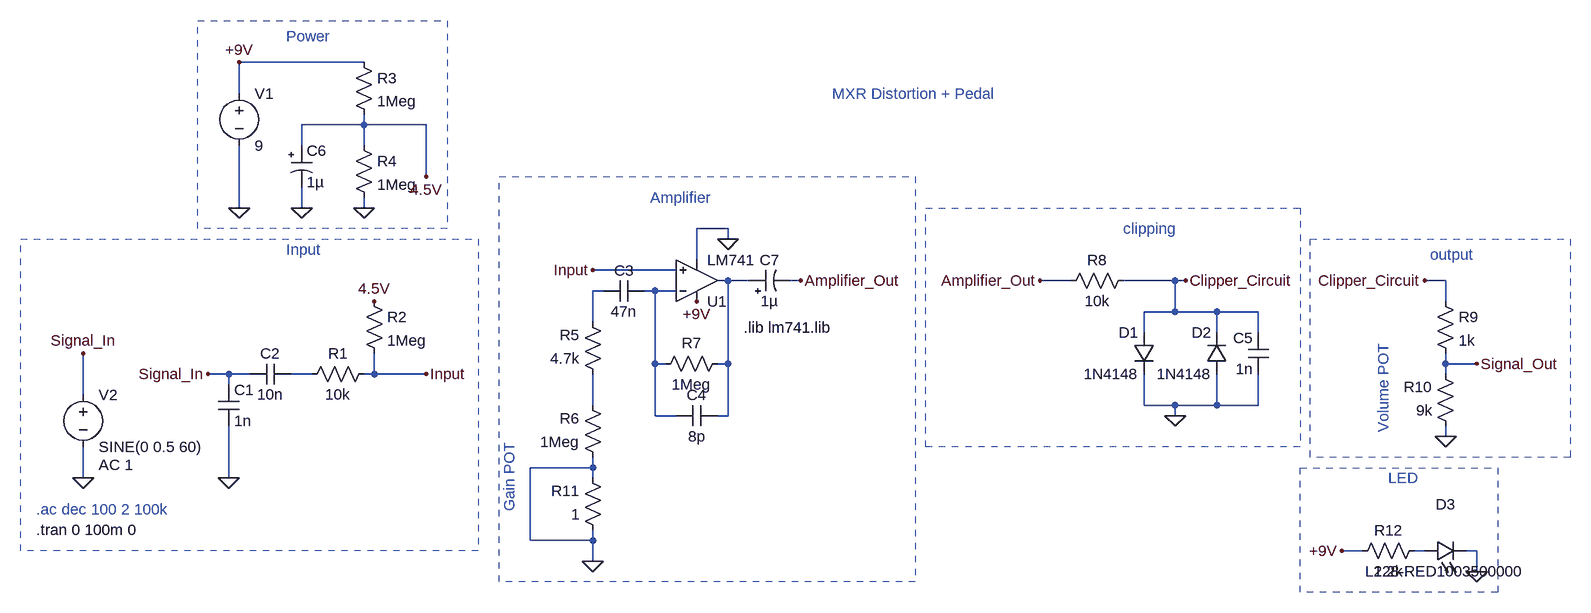
[diagram p0: schematic MXR Distortion + example.asc]
MXR Distortion + example.asc, the LTspice schematic file:
Version 4.1
SHEET 1 2292 1052
WIRE -224 -96 -416 -96
WIRE -416 -48 -416 -96
WIRE -224 0 -224 -16
WIRE -224 0 -320 0
WIRE -128 0 -224 0
WIRE -320 32 -320 0
WIRE -224 32 -224 0
WIRE -128 80 -128 0
WIRE -416 128 -416 32
WIRE -320 128 -320 96
WIRE -224 128 -224 112
WIRE 336 160 288 160
WIRE 336 176 336 160
WIRE 288 208 288 160
WIRE 256 224 128 224
WIRE 336 240 320 240
WIRE 368 240 336 240
WIRE 448 240 432 240
WIRE 864 240 816 240
WIRE 1024 240 944 240
WIRE 1040 240 1024 240
WIRE 1440 240 1408 240
WIRE 144 256 128 256
WIRE 224 256 208 256
WIRE 256 256 224 256
WIRE 1440 272 1440 240
WIRE 1024 288 1024 240
WIRE 1024 288 976 288
WIRE 1088 288 1024 288
WIRE 1152 288 1088 288
WIRE 128 304 128 256
WIRE 976 320 976 288
WIRE 1088 320 1088 288
WIRE 1152 320 1152 288
WIRE 224 368 224 256
WIRE 240 368 224 368
WIRE 336 368 336 240
WIRE 336 368 320 368
WIRE 1440 368 1440 352
WIRE 1488 368 1440 368
WIRE -432 384 -464 384
WIRE -400 384 -432 384
WIRE -304 384 -336 384
WIRE -208 384 -208 352
WIRE -208 384 -224 384
WIRE -128 384 -208 384
WIRE 1440 384 1440 368
WIRE -432 400 -432 384
WIRE -656 416 -656 352
WIRE 128 432 128 384
WIRE 976 432 976 384
WIRE 1024 432 976 432
WIRE 1088 432 1088 384
WIRE 1088 432 1024 432
WIRE 1152 432 1152 384
WIRE 1152 432 1088 432
WIRE 224 448 224 368
WIRE 256 448 224 448
WIRE 336 448 336 368
WIRE 336 448 320 448
WIRE 1024 448 1024 432
WIRE 1440 480 1440 464
WIRE 128 528 128 512
WIRE 128 528 32 528
WIRE -656 544 -656 496
WIRE -432 544 -432 464
WIRE 128 544 128 528
WIRE 32 640 32 528
WIRE 128 640 128 624
WIRE 128 640 32 640
WIRE 1312 656 1280 656
WIRE 1408 656 1392 656
WIRE 1488 656 1472 656
WIRE 128 672 128 640
WIRE 1488 688 1488 656
FLAG -416 128 0
FLAG 1024 448 0
FLAG 1440 480 0
FLAG 128 672 0
FLAG -432 544 0
FLAG -320 128 0
FLAG -224 128 0
FLAG -416 -96 +9V
FLAG 288 272 +9V
FLAG -128 80 4.5V
FLAG 336 176 0
FLAG 1488 688 0
FLAG 1280 656 +9V
FLAG -464 384 Signal_In
FLAG 1488 368 Signal_Out
FLAG 128 224 Input
FLAG 1040 240 Clipper_Circuit
FLAG 448 240 Amplifier_Out
FLAG -656 544 0
FLAG -656 352 Signal_In
FLAG 816 240 Amplifier_Out
FLAG 1408 240 Clipper_Circuit
FLAG -208 272 4.5V
FLAG -128 384 Input
SYMBOL voltage -416 -64 R0
WINDOW 123 24 124 Left 2
WINDOW 39 0 0 Left 0
SYMATTR InstName V1
SYMATTR Value 9
SYMBOL res -240 -112 R0
SYMATTR InstName R3
SYMATTR Value 1Meg
SYMBOL res -240 16 R0
SYMATTR InstName R4
SYMATTR Value 1Meg
SYMBOL res -224 256 R0
SYMATTR InstName R2
SYMATTR Value 1Meg
SYMBOL res -208 368 R90
WINDOW 0 0 56 VBottom 2
WINDOW 3 32 56 VTop 2
SYMATTR InstName R1
SYMATTR Value 10k
SYMBOL res 144 400 R180
WINDOW 0 36 76 Left 2
WINDOW 3 36 40 Left 2
SYMATTR InstName R5
SYMATTR Value 4.7k
SYMBOL res 144 528 R180
WINDOW 0 36 76 Left 2
WINDOW 3 36 40 Left 2
SYMATTR InstName R6
SYMATTR Value 1Meg
SYMBOL res 224 384 R270
WINDOW 0 32 56 VTop 2
WINDOW 3 0 56 VBottom 2
SYMATTR InstName R7
SYMATTR Value 1Meg
SYMBOL res 848 256 R270
WINDOW 0 32 56 VTop 2
WINDOW 3 0 56 VBottom 2
SYMATTR InstName R8
SYMATTR Value 10k
SYMBOL res 1424 256 R0
SYMATTR InstName R9
SYMATTR Value 1k
SYMBOL diode 992 320 M0
SYMATTR InstName D1
SYMATTR Value 1N4148
SYMBOL diode 1104 384 R180
WINDOW 0 24 64 Left 2
WINDOW 3 24 0 Left 2
SYMATTR InstName D2
SYMATTR Value 1N4148
SYMBOL cap -448 400 R0
SYMATTR InstName C1
SYMATTR Value 1n
SYMBOL cap -336 368 R90
WINDOW 0 0 32 VBottom 2
WINDOW 3 32 32 VTop 2
SYMATTR InstName C2
SYMATTR Value 10n
SYMBOL cap 208 240 R90
WINDOW 0 0 32 VBottom 2
WINDOW 3 32 32 VTop 2
SYMATTR InstName C3
SYMATTR Value 47n
SYMBOL cap 320 432 R90
WINDOW 0 0 32 VBottom 2
WINDOW 3 32 32 VTop 2
SYMATTR InstName C4
SYMATTR Value 8p
SYMBOL cap 1168 384 R180
WINDOW 0 24 56 Left 2
WINDOW 3 24 8 Left 2
SYMATTR InstName C5
SYMATTR Value 1n
SYMBOL polcap -336 32 R0
SYMATTR InstName C6
SYMATTR Value 1µ
SYMBOL polcap 368 256 R270
WINDOW 0 32 32 VTop 2
WINDOW 3 0 32 VBottom 2
SYMATTR InstName C7
SYMATTR Value 1µ
SYMBOL res 1456 480 R180
WINDOW 0 36 76 Left 2
WINDOW 3 36 40 Left 2
SYMATTR InstName R10
SYMATTR Value 9k
SYMBOL res 144 640 R180
WINDOW 0 36 76 Left 2
WINDOW 3 36 40 Left 2
SYMATTR InstName R11
SYMATTR Value 1
SYMBOL res 1408 640 R90
WINDOW 0 0 56 VBottom 2
WINDOW 3 32 56 VTop 2
SYMATTR InstName R12
SYMATTR Value 2.2k
SYMBOL LED 1408 672 R270
WINDOW 0 72 32 VTop 2
WINDOW 3 0 32 VBottom 2
SYMATTR InstName D3
SYMATTR Value L128-RED1003500000
SYMBOL voltage -656 400 R0
WINDOW 123 24 124 Left 2
WINDOW 39 0 0 Left 0
SYMATTR Value2 AC 1
SYMATTR InstName V2
SYMATTR Value SINE(0 0.5 60)
SYMBOL OpAmps\\opamp2 288 304 M180
SYMATTR InstName U1
SYMATTR Value LM741
TEXT -344 -136 Left 2 ;Power
TEXT -344 192 Left 2 ;Input
TEXT 216 112 Left 2 ;Amplifier
TEXT 944 160 Left 2 ;clipping
TEXT 1416 200 Left 2 ;output
TEXT 1352 544 Left 2 ;LED
TEXT -728 624 Left 2 !.tran 0 100m 0
TEXT 1344 336 VRight 2 ;Volume POT
TEXT 0 488 VRight 2 ;Gain POT
TEXT -728 592 Left 2 ;.ac dec 100 2 100k
TEXT 360 312 Left 2 !.lib lm741.lib
TEXT 496 -48 Left 2 ;MXR Distortion + Pedal
RECTANGLE Normal -96 160 -480 -160 2
RECTANGLE Normal -48 656 -752 176 2
RECTANGLE Normal 624 704 -16 80 2
RECTANGLE Normal 1216 496 640 128 2
RECTANGLE Normal 1632 512 1232 176 2
RECTANGLE Normal 1520 720 1216 528 2

The netlist it stands for:
* MXR Distortion + example.asc
V1 +9V 0 9
R3 +9V 4.5V 1Meg
R4 4.5V 0 1Meg
R2 4.5V Input 1Meg
R1 Input N004 10k
R5 N005 N002 4.7k
R6 0 N005 1Meg
R7 N003 N001 1Meg
R8 Amplifier_Out Clipper_Circuit 10k
R9 Clipper_Circuit Signal_Out 1k
D1 Clipper_Circuit 0 1N4148
D2 0 Clipper_Circuit 1N4148
C1 Signal_In 0 1n
C2 N004 Signal_In 10n
C3 N003 N002 47n
C4 N001 N003 8p
C5 0 Clipper_Circuit 1n
C6 4.5V 0 1µ
C7 N001 Amplifier_Out 1µ
R10 0 Signal_Out 9k
R11 0 0 1
R12 N006 +9V 2.2k
D3 N006 0 L128-RED1003500000
V2 Signal_In 0 SINE(0 0.5 60) AC 1
X§U1 Input N003 +9V 0 N001 LM741  ; pins In+ In- V+ V- OUT
.model D D
.lib standard.dio
* Power
* Input
* Amplifier
* clipping
* output
* LED
.tran 0 100m 0
* Volume POT
* Gain POT
* .ac dec 100 2 100k
.lib lm741.lib
* MXR Distortion + Pedal
.backanno
.end